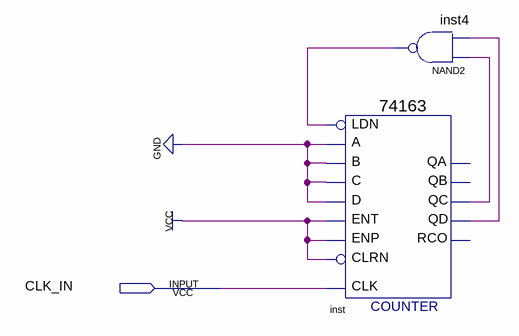
[diagram p0: schematic sheet]
// Quartus schematic SpecialCount.bdf as structural Verilog: 2 symbols, 1 pins
module SpecialCount (
  input  CLK_IN
);

  wire inst4_out, inst_qc, inst_qd;

  \74163  inst (
    .C(1'b0), .B(1'b0), .A(1'b0), .ENT(1'b1), .D(1'b0), .CLRN(1'b1), .CLK(CLK_IN), .ENP(1'b1),
    .LDN(inst4_out), .QC(inst_qc), .QD(inst_qd));  // open: QA, QB, RCO
  nand inst4 (inst4_out, inst_qc, inst_qd);
endmodule
